# Altium schematic sheet 05_RISK_MEMORY.SchDoc
size A4; SheetNumber: 5; SheetTotal: 6
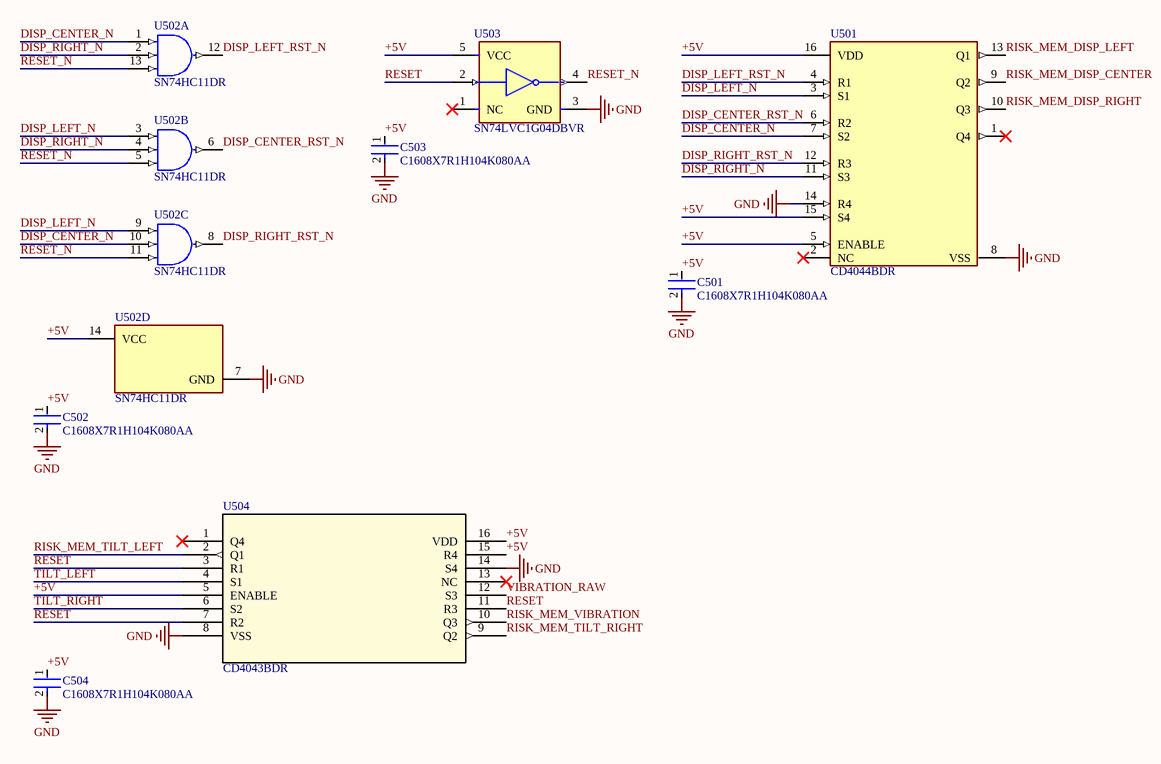
[diagram p0: 05_RISK_MEMORY.SchDoc]

## Parts
C501  C1608X7R1H104K080AA  [FP-C1608-080-0_1-IPC_B]
C502  C1608X7R1H104K080AA  [FP-C1608-080-0_1-IPC_B]
C503  C1608X7R1H104K080AA  [FP-C1608-080-0_1-IPC_B]
C504  C1608X7R1H104K080AA  [FP-C1608-080-0_1-IPC_B]
U501  CD4044BDR  [FP-D0016A-IPC_C]
U502  SN74HC11DR  [FP-D0014A-IPC_C]  (parts A,B,C,D of 4)
U503  SN74LVC1G04DBVR  [FP-DBV0005A-MFG]
U504  CD4043BDR  [D16]

## Nets
GND: C501.2 C502.2 C503.2 C504.2 U501.8(VSS) U501.14(R4) U502.7(GND) U503.3(GND) U504.8(VSS) U504.14(S4)
+5V: C501.1 C502.1 C503.1 C504.1 U501.5(ENABLE) U501.15(S4) U501.16(VDD) U502.14(VCC) U503.5(VCC) U504.5(ENABLE) U504.15(R4) U504.16(VDD)
DISP_CENTER_N: U501.7(S2) U502.1(1A) U502.10(3B)
DISP_CENTER_RST_N: U501.6(R2) U502.6(2Y)
DISP_LEFT_N: U501.3(S1) U502.3(2A) U502.9(3A)
DISP_LEFT_RST_N: U501.4(R1) U502.12(1Y)
DISP_RIGHT_N: U501.11(S3) U502.2(1B) U502.4(2B)
DISP_RIGHT_RST_N: U501.12(R3) U502.8(3Y)
RESET: U503.2(A) U504.3(R1) U504.7(R2) U504.11(R3)
RESET_N: U502.5(2C) U502.11(3C) U502.13(1C) U503.4(Y)
RISK_MEM_DISP_CENTER: U501.9(Q2)
RISK_MEM_DISP_LEFT: U501.13(Q1)
RISK_MEM_DISP_RIGHT: U501.10(Q3)
RISK_MEM_TILT_LEFT: U504.2(Q1)
RISK_MEM_TILT_RIGHT: U504.9(Q2)
RISK_MEM_VIBRATION: U504.10(Q3)
TILT_LEFT: U504.4(S1)
TILT_RIGHT: U504.6(S2)
VIBRATION_RAW: U504.12(S3)

Not connected (* = marked no-connect by the designer): U501 1(Q4)* 2(NC)*; U503 1(NC)*; U504 1(Q4)* 13(NC)*

## Library data of the parts
C501-C504 = CMP-2000-04982-2: Multilayer Ceramic Capacitors 100nF ±10% 50V X7R SMD 0603; REACH SVHC: No SVHC; Voltage: 50V; Min Operating Temperature: -55°C; Package Quantity: 1; Case Code (Metric): 1608; Series: C; Termination: SMD/SMT; Length: 1.6mm; Voltage Rating: 50V; Case Code (Imperial): 0603; Number of Pins: 2; RoHS Compliant: Yes; Thickness: 0.037inch; Resistor Type: Ceramic; Radiation Hardening: No; Weight: 7.1E-05oz; Mount: Surface Mount; Capacitance: 100nF; Voltage Rating (DC): 50V; Construction: Flat; Tolerance: 10%; Lead Free: Lead Free; Case/Package: 0603; Max Operating Temperature: 125°C; Height: 0.8mm; Depth: 0.8mm; Packaging: Tape and Reel; Width: 0.031inch; Dielectric Material: Ceramic; Dielectric: X7R
U501 = CMP-04902-000018-1: IC QUAD NAND R/S LATCH 16SOIC; Polarity: Non-Inverting; Min Supply Voltage: 3V; Number of Output Lines: 4; Output Type: 3-STATE; Max Supply Voltage: 18V; Turn-On Delay Time: 50ns; Number of Elements: 1; Number of Input Lines: 8; Output Current: 6.8mA; High Level Output Current: -4.2mA; Low Level Output Current: 4.2mA; Quiescent Current: 20uA; Propagation Delay: 300ns; Mount: Surface Mount; Packaging: Tape and Reel; Weight: 0.004998oz; Contact Plating: Gold; Independent Circuits: 4; Number of Pins: 16; Number of Bits: 4; Max Operating Temperature: 125°C; Radiation Hardening: No; Case/Package: SOIC; Number of Circuits: 1; Technology: CMOS; Min Operating Temperature: -55°C; Package Quantity: 1; Lead Free: Lead Free; RoHS Compliant: Yes; Logic Function: Latch; Series: 4000B
U502 = CMP-0777-00002-4: IC GATE AND 3CH 3-INP 14SOIC; Number of Gates: 3; High Level Output Current: -5.2mA; Max Supply Voltage: 6V; Low Level Output Current: 5.2mA; Quiescent Current: 2uA; Number of Outputs: 1; Propagation Delay: 17ns; Turn-On Delay Time: 25ns; Output Current: 25mA; Operating Supply Voltage: 5V; Min Supply Voltage: 2V; Logic Function: AND GATE; Max Operating Temperature: 85°C; Package Quantity: 1; Weight: 0.004318oz; Contact Plating: Gold; Number of Input Lines: 3; Packaging: Tape and Reel; Radiation Hardening: No; Number of Circuits: 3; Number of Elements: 3; Number of Pins: 14; Lead Free: Lead Free; Case/Package: SOIC; Number of Inputs: 3; Mount: Surface Mount; Min Operating Temperature: -40°C; Number of Bits: 3; Number of Output Lines: 1; REACH SVHC: No SVHC; RoHS Compliant: Yes
U503 = CMP-0859-00134-4: IC INVERTER 1CH 1-INP SOT23-5; Number of Elements: 1; Turn-On Delay Time: 7.5ns; Propagation Delay: 3.7ns; Max Supply Voltage: 5.5V; Max Output Current: 32mA; Quiescent Current: 10uA; High Level Output Current: -32mA; Schmitt Trigger Input: No; Min Supply Voltage: 1.65V; Number of Circuits: 1; Lead Free: Lead Free; Number of Inputs: 1; Mount: Surface Mount; Length: 3.05mm; Width: 1.75mm; Number of Pins: 5; Case/Package: SOT-23; REACH SVHC: No SVHC; Low Level Output Current: 32mA; Package Quantity: 1; Height: 1.3mm; Radiation Hardening: No; Packaging: Tape and Reel; Output Current: 32mA; Max Operating Temperature: 125°C; Termination: SMD/SMT; Min Operating Temperature: -40°C; Number of Gates: 1; Weight: 0.000557oz; Logic Function: Inverter; Number of Bits: 1; Contact Plating: Tin
U504 = CD4043BDR: CMOS Quad NOR R/S Latch with 3-State Outputs 16-SOIC -55 to 125; Manufacturer_Name: Texas Instruments; Copyright: Copyright (C) 2025 Ultra Librarian. All rights reserved.; Manufacturer_Part_Number: CD4043BDR; RefDes: RefDes; Type: Type